# Altium schematic sheet mcu.SchDoc
size A4; SheetNumber: 2; SheetTotal: 3
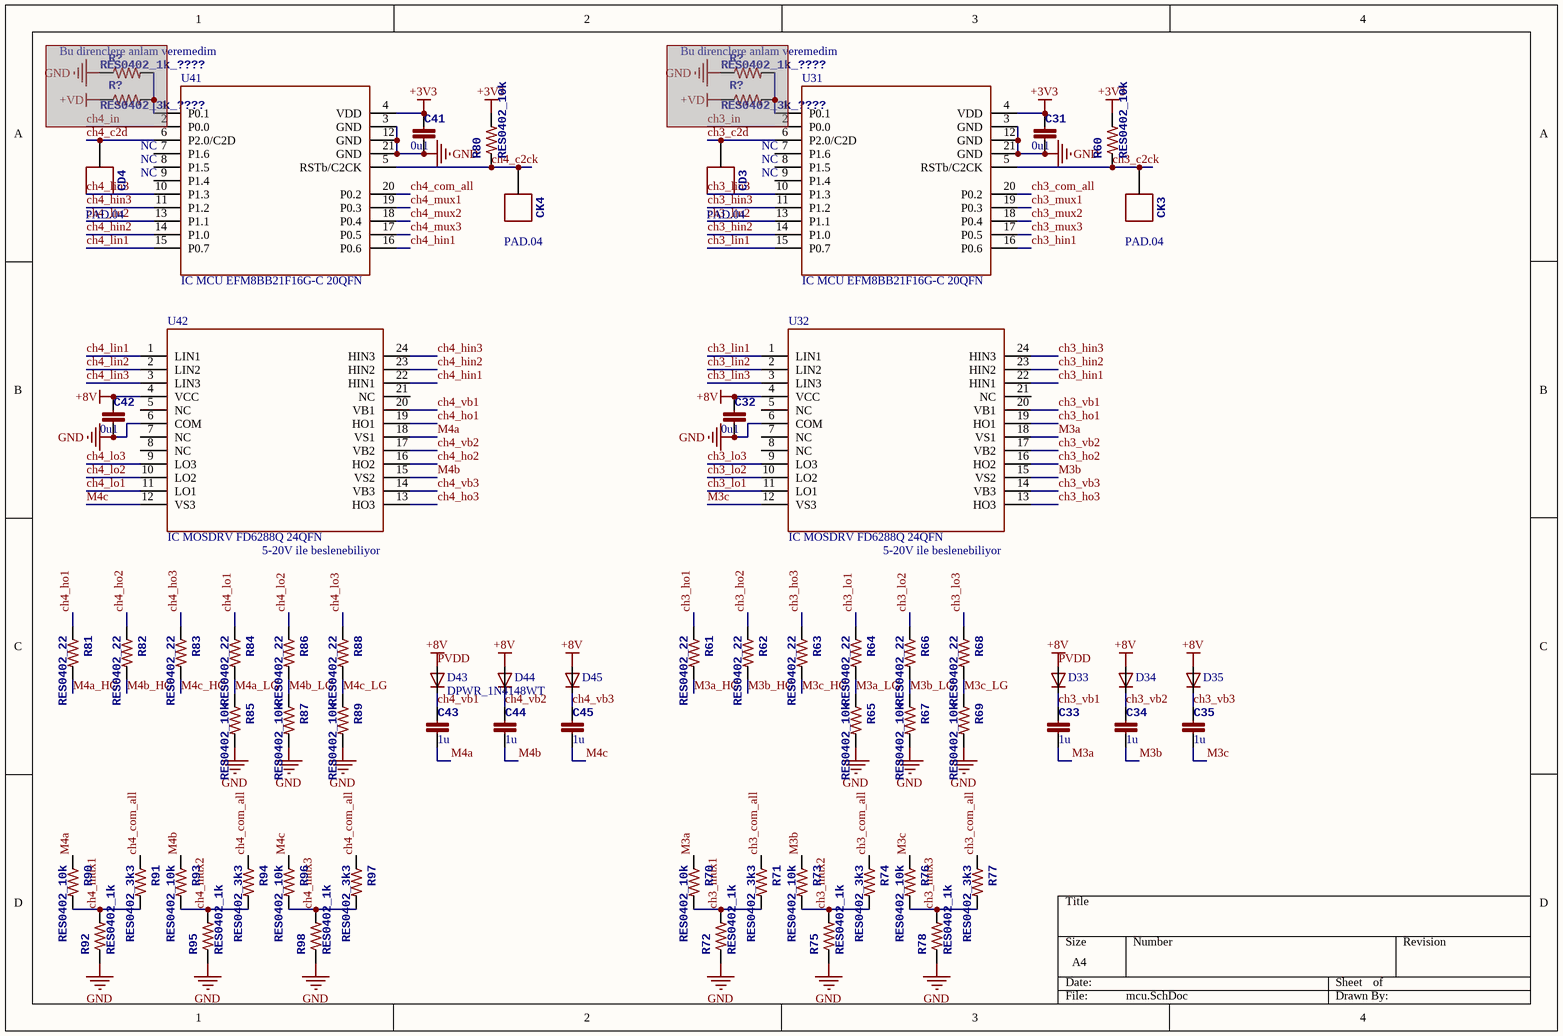
[diagram p0: mcu.SchDoc]

## Parts
(Parts that share a designator on the sheet are numbered #1, #2 ... from top to bottom, then left to right.)
C31  value 0u1  [0402-CAP]  (hidden comment: CAP0402_0u1_16V_X7R)
C32  value 0u1  [0402-CAP]  (hidden comment: CAP0402_0u1_16V_X7R)
C33  value 1u  [0402-CAP]  (hidden comment: CAP0402_1u_16V_X5R)
C34  value 1u  [0402-CAP]  (hidden comment: CAP0402_1u_16V_X5R)
C35  value 1u  [0402-CAP]  (hidden comment: CAP0402_1u_16V_X5R)
C41  value 0u1  [0402-CAP]  (hidden comment: CAP0402_0u1_16V_X7R)
C42  value 0u1  [0402-CAP]  (hidden comment: CAP0402_0u1_16V_X7R)
C43  value 1u  [0402-CAP]  (hidden comment: CAP0402_1u_16V_X5R)
C44  value 1u  [0402-CAP]  (hidden comment: CAP0402_1u_16V_X5R)
C45  value 1u  [0402-CAP]  (hidden comment: CAP0402_1u_16V_X5R)
CD3  PAD.04  [PAD.04X.04]  (no BOM)
CD4  PAD.04  [PAD.04X.04]  (no BOM)
CK3  PAD.04  [PAD.04X.04]  (no BOM)
CK4  PAD.04  [PAD.04X.04]  (no BOM)
D33  DPWR_1N4148WT  [SOD-523_0P9X1P3]  (value not drawn)
D34  DPWR_1N4148WT  [SOD-523_0P9X1P3]  (value not drawn)
D35  DPWR_1N4148WT  [SOD-523_0P9X1P3]  (value not drawn)
D43  DPWR_1N4148WT  [SOD-523_0P9X1P3]
D44  DPWR_1N4148WT  [SOD-523_0P9X1P3]  (value not drawn)
D45  DPWR_1N4148WT  [SOD-523_0P9X1P3]  (value not drawn)
R60  RES0402_10k  [0402-RES]
R61  RES0402_22  [0402-RES]
R62  RES0402_22  [0402-RES]
R63  RES0402_22  [0402-RES]
R64  RES0402_22  [0402-RES]
R65  RES0402_10k  [0402-RES]
R66  RES0402_22  [0402-RES]
R67  RES0402_10k  [0402-RES]
R68  RES0402_22  [0402-RES]
R69  RES0402_10k  [0402-RES]
R70  RES0402_10k  [0402-RES]
R71  RES0402_3k3  [0402-RES]
R72  RES0402_1k  [0402-RES]
R73  RES0402_10k  [0402-RES]
R74  RES0402_3k3  [0402-RES]
R75  RES0402_1k  [0402-RES]
R76  RES0402_10k  [0402-RES]
R77  RES0402_3k3  [0402-RES]
R78  RES0402_1k  [0402-RES]
R80  RES0402_10k  [0402-RES]
R81  RES0402_22  [0402-RES]
R82  RES0402_22  [0402-RES]
R83  RES0402_22  [0402-RES]
R84  RES0402_22  [0402-RES]
R85  RES0402_10k  [0402-RES]
R86  RES0402_22  [0402-RES]
R87  RES0402_10k  [0402-RES]
R88  RES0402_22  [0402-RES]
R89  RES0402_10k  [0402-RES]
R90  RES0402_10k  [0402-RES]
R91  RES0402_3k3  [0402-RES]
R92  RES0402_1k  [0402-RES]
R93  RES0402_10k  [0402-RES]
R94  RES0402_3k3  [0402-RES]
R95  RES0402_1k  [0402-RES]
R96  RES0402_10k  [0402-RES]
R97  RES0402_3k3  [0402-RES]
R98  RES0402_1k  [0402-RES]
R?#1  RES0402_1k_????  [0402-RES]  (masked out: inside a compile mask, not in the netlist)
R?#2  RES0402_1k_????  [0402-RES]  (masked out: inside a compile mask, not in the netlist)
R?#3  RES0402_3k_????  [0402-RES]  (masked out: inside a compile mask, not in the netlist)
R?#4  RES0402_3k_????  [0402-RES]  (masked out: inside a compile mask, not in the netlist)
U31  IC MCU EFM8BB21F16G-C 20QFN  [QFN20_3X3_SIL]
U32  IC MOSDRV FD6288Q 24QFN  [QFN-24(4x4)]
U41  IC MCU EFM8BB21F16G-C 20QFN  [QFN20_3X3_SIL]
U42  IC MOSDRV FD6288Q 24QFN  [QFN-24(4x4)]

## Nets
+3V3: C31.P$1 C41.P$1 R60.P$2 R80.P$2 U31.4(VDD) U41.4(VDD)
GND: C31.P$2 C32.P$2 C41.P$2 C42.P$2 R65.P$2 R67.P$2 R69.P$2 R72.P$1 R75.P$1 R78.P$1 R85.P$2 R87.P$2 R89.P$2 R92.P$1 R95.P$1 R98.P$1 U31.3(GND) U31.12(GND) U31.21(GND) U32.6(COM) U41.3(GND) U41.12(GND) U41.21(GND) U42.6(COM)
PVDD: C32.P$1 C42.P$1 D33.A D34.A D35.A D43.A D44.A D45.A U32.4(VCC) U42.4(VCC)  [also labelled +8V]
ch3_c2ck: CK3.P$1 R60.P$1 U31.5(RSTb/C2CK)
ch3_c2d: CD3.P$1 U31.6(P2.0/C2D)
ch3_com_all: R71.P$1 R74.P$1 R77.P$1 U31.20(P0.2)
ch3_hin1: U31.16(P0.6) U32.22(HIN1)
ch3_hin2: U31.14(P1.0) U32.23(HIN2)
ch3_hin3: U31.11(P1.2) U32.24(HIN3)
ch3_ho1: R61.P$1 U32.19(HO1)
ch3_ho2: R62.P$1 U32.16(HO2)
ch3_ho3: R63.P$1 U32.13(HO3)
ch3_lin1: U31.15(P0.7) U32.1(LIN1)
ch3_lin2: U31.13(P1.1) U32.2(LIN2)
ch3_lin3: U31.10(P1.3) U32.3(LIN3)
ch3_lo1: R64.P$1 U32.11(LO1)
ch3_lo2: R66.P$1 U32.10(LO2)
ch3_lo3: R68.P$1 U32.9(LO3)
ch3_mux1: R70.P$2 R71.P$2 R72.P$2 U31.19(P0.3)
ch3_mux2: R73.P$2 R74.P$2 R75.P$2 U31.18(P0.4)
ch3_mux3: R76.P$2 R77.P$2 R78.P$2 U31.17(P0.5)
ch3_vb1: C33.P$1 D33.K U32.20(VB1)
ch3_vb2: C34.P$1 D34.K U32.17(VB2)
ch3_vb3: C35.P$1 D35.K U32.14(VB3)
ch4_c2ck: CK4.P$1 R80.P$1 U41.5(RSTb/C2CK)
ch4_c2d: CD4.P$1 U41.6(P2.0/C2D)
ch4_com_all: R91.P$1 R94.P$1 R97.P$1 U41.20(P0.2)
ch4_hin1: U41.16(P0.6) U42.22(HIN1)
ch4_hin2: U41.14(P1.0) U42.23(HIN2)
ch4_hin3: U41.11(P1.2) U42.24(HIN3)
ch4_ho1: R81.P$1 U42.19(HO1)
ch4_ho2: R82.P$1 U42.16(HO2)
ch4_ho3: R83.P$1 U42.13(HO3)
ch4_lin1: U41.15(P0.7) U42.1(LIN1)
ch4_lin2: U41.13(P1.1) U42.2(LIN2)
ch4_lin3: U41.10(P1.3) U42.3(LIN3)
ch4_lo1: R84.P$1 U42.11(LO1)
ch4_lo2: R86.P$1 U42.10(LO2)
ch4_lo3: R88.P$1 U42.9(LO3)
ch4_mux1: R90.P$2 R91.P$2 R92.P$2 U41.19(P0.3)
ch4_mux2: R93.P$2 R94.P$2 R95.P$2 U41.18(P0.4)
ch4_mux3: R96.P$2 R97.P$2 R98.P$2 U41.17(P0.5)
ch4_vb1: C43.P$1 D43.K U42.20(VB1)
ch4_vb2: C44.P$1 D44.K U42.17(VB2)
ch4_vb3: C45.P$1 D45.K U42.14(VB3)
M3a: C33.P$2 R70.P$1 U32.18(VS1)
M3a_HG: R61.P$2
M3a_LG: R64.P$2 R65.P$1
M3b: C34.P$2 R73.P$1 U32.15(VS2)
M3b_HG: R62.P$2
M3b_LG: R66.P$2 R67.P$1
M3c: C35.P$2 R76.P$1 U32.12(VS3)
M3c_HG: R63.P$2
M3c_LG: R68.P$2 R69.P$1
M4a: C43.P$2 R90.P$1 U42.18(VS1)
M4a_HG: R81.P$2
M4a_LG: R84.P$2 R85.P$1
M4b: C44.P$2 R93.P$1 U42.15(VS2)
M4b_HG: R82.P$2
M4b_LG: R86.P$2 R87.P$1
M4c: C45.P$2 R96.P$1 U42.12(VS3)
M4c_HG: R83.P$2
M4c_LG: R88.P$2 R89.P$1

Not connected (* = marked no-connect by the designer): U31 1(P0.1) 2(P0.0) 7(P1.6) 8(P1.5) 9(P1.4); U32 5(NC) 7(NC) 8(NC) 21(NC); U41 1(P0.1) 2(P0.0) 7(P1.6) 8(P1.5) 9(P1.4); U42 5(NC) 7(NC) 8(NC) 21(NC)

## Notes on the sheet
- (near R?#1) Bu direnclere anlam veremedim
- (near R?#2) Bu direnclere anlam veremedim
- NC
- (near U42) 5-20V ile beslenebiliyor
- (near U32) 5-20V ile beslenebiliyor

## Library data of the parts
C31 C32 C41 C42 = CAP0402_0u1_16V_X7R: X7R 100nF 16V ±10% 0402 Multilayer Ceramic Capacitors MLCC - SMD/SMT ROHS; Manufacturer Product Number: CL05B104KO3LNNC; LSCS Part Number: C1525; Voltage Rating: 16; Digikey Part Number: 1276-1507-1-ND; Package: 0402
C33-C35 C43-C45 = CAP0402_1u_16V_X5R: X5R 1uF 16V ±10% 0402 Multilayer Ceramic Capacitors MLCC - SMD/SMT ROHS; Manufacturer Product Number: CL05A105KO5NNNC; LSCS Part Number: C29266; Digikey Part Number: 1276-1067-1-ND; Package: 0402; Voltage Rating: 16V
CD3 CD4 CK3 CK4 = X PADS.04
D33-D35 D43-D45 = DPWR_1N4148WT: 75V Independent Type 1.25V@150mA 4ns 150mA SOD-523 Switching Diodes ROHS; LSCS Part Number: C917006; Manufacturer Product Number: 1N4148WT; Package: SOD523; Digikey Part Number: 1N4148WTCT-ND
R60 R65 R67 R69 R70 R73 R76 R80 R85 R87 R89 R90 R93 R96 = RES0402_10k: 50V Thick Film Resistors 62.5mW 110kΩ ±1% ±100ppm/℃ 0402 Chip Resistor - Surface Mount ROHS; Manufacturer Product Number: RC0402FR-0710KL; LSCS Part Number: C60490; Value: 10k; Package: 0402; Digikey Part Number: 311-10.0KLRCT-ND
R61-R64 R66 R68 R81-R84 R86 R88 = RES0402_22: 62.5mW Thick Film Resistors 50V ±1% ±100ppm/℃ 22Ω 0402 Chip Resistor - Surface Mount ROHS; Manufacturer Product Number: RC0402FR-0722RL; LSCS Part Number: C114765; Value: 22; Package: 0402; Digikey Part Number: 311-22.0LRCT-ND
R71 R74 R77 R91 R94 R97 = RES0402_3k3: 62.5mW Thick Film Resistors 50V ±100ppm/℃ ±1% 3.3kΩ 0402 Chip Resistor - Surface Mount ROHS; Manufacturer Product Number: RC0402FR-073K3L; LSCS Part Number: C137992; Value: 3k3; Package: 0402; Digikey Part Number: 1712-CRG0402F3K3CT-ND
R72 R75 R78 R92 R95 R98 = RES0402_1k: 62.5mW Thick Film Resistors 50V ±100ppm/℃ ±1% 1kΩ 0402 Chip Resistor - Surface Mount ROHS; Manufacturer Product Number: RC0402JR-071KL; LSCS Part Number: C105637; Value: 1k; Package: 0402; Digikey Part Number: 311-1.0KJRCT-ND
R?#1 R?#2 = RES0402_1k_????: Value: 1k; Supplier Part Number 1: *; Manufacturer Product Number: *; Supplier Part Number 2: *; Package: 0402
R?#3 R?#4 = RES0402_3k_????: Value: 3k; Supplier Part Number 1: *; Manufacturer Product Number: *; Supplier Part Number 2: *; Package: 0402
U31 U41 = IC MCU EFM8BB21F16G-C 20QFN: IC MCU 8BIT 16KB FLASH 20QFN; LSCS Part Number: C80713; Manufacturer Product Number: EFM8BB21F16G-C-QFN20R; Digikey Part Number: 336-4743-1-ND; Package: 20QFN
U32 U42 = IC MOSDRV FD6288Q 24QFN: High and low sides MOSFET 1.8A 8V~20V 1.5A QFN-24 Gate Drivers ROHS; LSCS Part Number: C328453; Digikey Part Number: N/A; Package: 24QFN(4x4); Manufacturer Product Number: FD6288Q